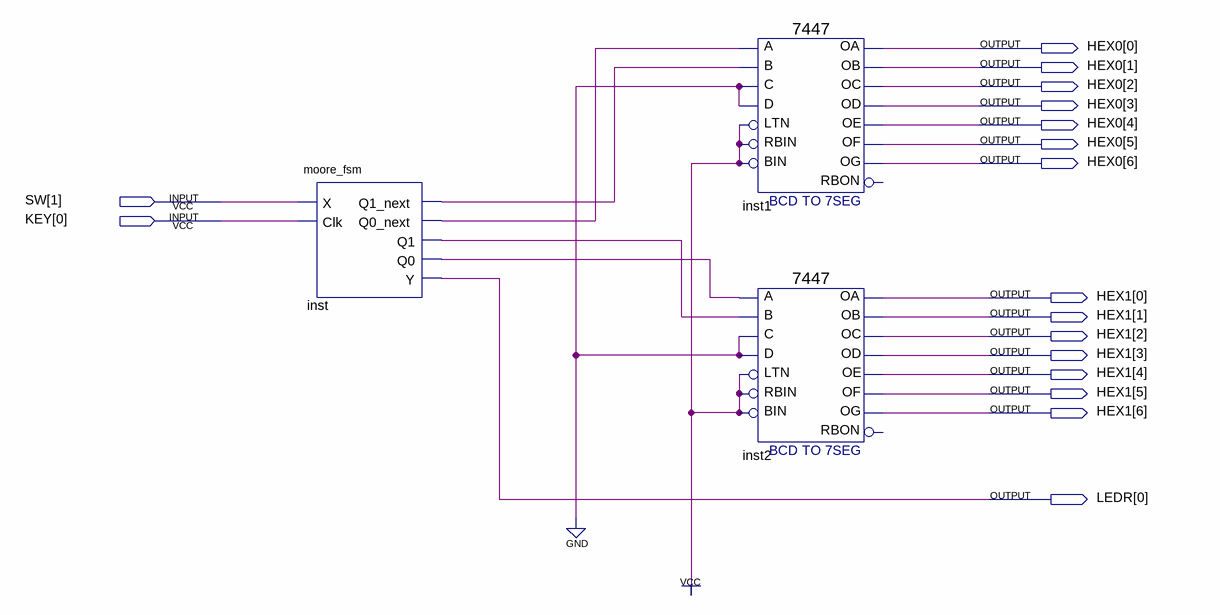
[diagram p0: schematic sheet]
// Quartus schematic moore_fsm_kit.bdf as structural Verilog: 3 symbols, 17 pins
module moore_fsm_kit (
  input  [1:1] SW,
  input  [0:0] KEY,
  output [6:0] HEX0,
  output [6:0] HEX1,
  output [0:0] LEDR
);

  wire inst_q0, inst_q0_next, inst_q1, inst_q1_next;

  moore_fsm inst (
    .X(SW[1]), .Clk(KEY[0]), .Q1_next(inst_q1_next), .Q0_next(inst_q0_next), .Q1(inst_q1), .Q0(inst_q0),
    .Y(LEDR[0]));
  \7447  inst1 (
    .LTN(1'b1), .B(inst_q1_next), .C(1'b0), .D(1'b0), .RBIN(1'b1), .BIN(1'b1), .A(inst_q0_next),
    .OB(HEX0[1]), .OC(HEX0[2]), .OE(HEX0[4]), .OD(HEX0[3]), .OF(HEX0[5]), .OG(HEX0[6]), .OA(HEX0[0]));  // open: RBON
  \7447  inst2 (
    .LTN(1'b1), .B(inst_q1), .C(1'b0), .D(1'b0), .RBIN(1'b1), .BIN(1'b1), .A(inst_q0), .OB(HEX1[1]),
    .OC(HEX1[2]), .OE(HEX1[4]), .OD(HEX1[3]), .OF(HEX1[5]), .OG(HEX1[6]), .OA(HEX1[0]));  // open: RBON
endmodule
